# Altium schematic sheet GPIOs_Power.SchDoc
size A4; SheetNumber: 5; SheetTotal: 5
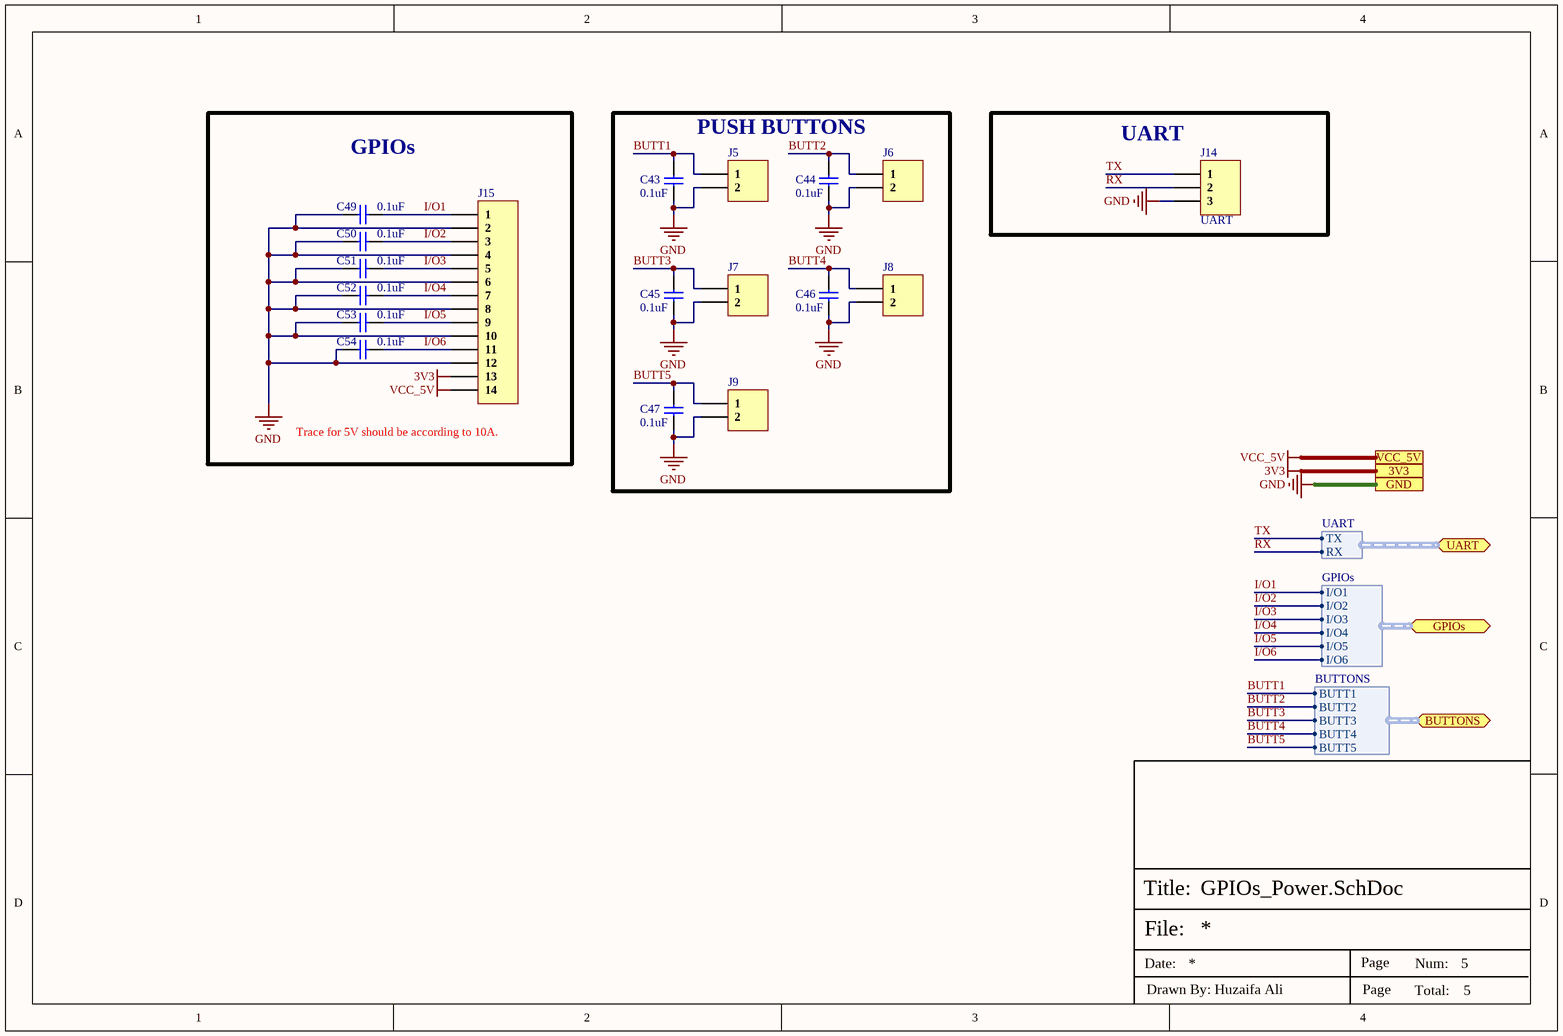
[diagram p0: GPIOs_Power.SchDoc]

## Parts
C43  0.1uF  [Cap-0603]
C44  0.1uF  [Cap-0603]
C45  0.1uF  [Cap-0603]
C46  0.1uF  [Cap-0603]
C47  0.1uF  [Cap-0603]
C49  0.1uF  [Cap-0603]
C50  0.1uF  [Cap-0603]
C51  0.1uF  [Cap-0603]
C52  0.1uF  [Cap-0603]
C53  0.1uF  [Cap-0603]
C54  0.1uF  [Cap-0603]
J5  2P THrough Hole Pads  [2P THrough Hole Pads]  (value not drawn)
J6  2P THrough Hole Pads  [2P THrough Hole Pads]  (value not drawn)
J7  2P THrough Hole Pads  [2P THrough Hole Pads]  (value not drawn)
J8  2P THrough Hole Pads  [2P THrough Hole Pads]  (value not drawn)
J9  2P THrough Hole Pads  [2P THrough Hole Pads]  (value not drawn)
J14  UART  [3P Through Hole Pads]
J15  DNP  [14P Through Hole Pads_]  (value not drawn)

## Blocks framed on the sheet
GPIOs: C49-C54 J15
PUSH BUTTONS: C43-C47 J5-J9
UART: J14

## Ports
3V3, BUTTONS (bidir, harness BUTTONS), GND, GPIOs (bidir, harness GPIOs), UART (bidir, harness UART), VCC_5V

## Harnesses
GPIOs: I/O1, I/O2, I/O3, I/O4, I/O5, I/O6
BUTTONS: BUTT1, BUTT2, BUTT3, BUTT4, BUTT5
UART: TX, RX

## Nets
3V3: J15.13 ; port 3V3
GND: C43.1 C44.1 C45.1 C46.1 C47.1 C49.2 C50.2 C51.2 C52.2 C53.2 C54.2 J5.2 J6.2 J7.2 J8.2 J9.2 J14.3 J15.2 J15.4 J15.6 J15.8 J15.10 J15.12 ; port GND
VCC_5V: J15.14 ; port VCC_5V
BUTT1: C43.2 J5.1 ; port BUTTONS.BUTT1
BUTT2: C44.2 J6.1 ; port BUTTONS.BUTT2
BUTT3: C45.2 J7.1 ; port BUTTONS.BUTT3
BUTT4: C46.2 J8.1 ; port BUTTONS.BUTT4
BUTT5: C47.2 J9.1 ; port BUTTONS.BUTT5
I/O1: C49.1 J15.1 ; port GPIOs.I/O1
I/O2: C50.1 J15.3 ; port GPIOs.I/O2
I/O3: C51.1 J15.5 ; port GPIOs.I/O3
I/O4: C52.1 J15.7 ; port GPIOs.I/O4
I/O5: C53.1 J15.9 ; port GPIOs.I/O5
I/O6: C54.1 J15.11 ; port GPIOs.I/O6
RX: J14.2 ; port UART.RX
TX: J14.1 ; port UART.TX

## Notes on the sheet
- (near J15) Trace for 5V should be according to 10A.
- File:
- Title:
- Date:
- Page
- Num:
- Total:
- Drawn By: Huzaifa Ali

## Library data of the parts
C43-C47 C49-C54 = CC0603KRX5R9BB104: CAP CER 0.1UF 50V X5R 0603; Manufacturer: Yageo; Capacitance: 100nF; Tolerance: 10%; Item Type: Capacitor; Supplier 1: Digi-Key; Manufacturer Part Number: CC0603KRX5R9BB104; RoHS: Yes; Category: Ceramic Capacitors; Stock 1: 152253; Pricing 1: 1=0.10000, 10=0.05200, 50=0.02820, 100=0.02310, 500=0.01648, 1000=0.01294 (USD); Mount: Surface Mount; Case/Package: 0603; Case Code (Imperial): 0603; Case Code (Metric): 1608; Weight: 7.1E-05oz; Min Operating Temperature: -55°C; Max Operating Temperature: 85°C; Packaging: Tape and Reel; Voltage Rating: 50V; Dielectric: X5R; Termination: SMD/SMT; Voltage Rating (DC): 50V; Package Quantity: 4000; Length: 0.063inch; Width: 0.031inch; Thickness: 0.035inch; Lead Free: Lead Free; Halogen Free: Halogen Free; ComponentLink1URL: http://www.mouser.com/ds/2/447/Yageo_UPY-GP_NP0_16V-to-50V_9-358835.pdf?src-supplier=Mouser; ComponentLink1Description: http://www.mouser.com/ds/2/447/Yageo_UPY-GP_NP0_16V-to-50V_9-358835.pdf?src-supplier=Mouser; ComponentLink2URL: https://www.yageo.com/upload/media/product/productsearch/datasheet/mlcc/UPY-GPHC_X5R_4V-to-50V_26.pdf?src-supplier=Digi-Key; ComponentLink2Description: https://www.yageo.com/upload/media/product/productsearch/datasheet/mlcc/UPY-GPHC_X5R_4V-to-50V_26.pdf?src-supplier=Digi-Key; ComponentLink3URL: http://www.yageo.com/exep/pages/download/literatures/ProductSelectionGuide%202014_Final_2.pdf?src-supplier=Digi-Key; ComponentLink3Description: http://www.yageo.com/exep/pages/download/literatures/ProductSelectionGuide%202014_Final_2.pdf?src-supplier=Digi-Key; Supplier Part Number 1: 311-4046-1-ND; LCSC Part Number: C110022
J5-J9 = 2P THrough Hole Pads: Wire Connecting Pad; Manufacturer Part Number: 2P THrough Hole Pads; Item Type: THrough Hole Pads
J14 = 3P Through Hole Pads: Wire Connecting Pads; Manufacturer Part Number: 3P Through Hole Pads; Item Type: Through Hole Pads
J15 = 14P Through Hole Pads: Wire Connecting Pads; Manufacturer Part Number: 14P Through Hole Pads; Item Type: Through Hole Pads